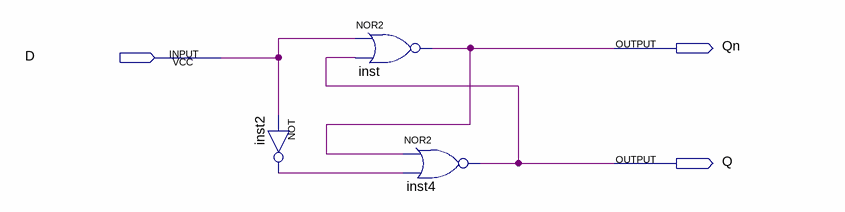
[diagram p0: schematic sheet]
// Quartus schematic Block2.bdf as structural Verilog: 3 symbols, 3 pins
module Block2 (
  input  D,
  output Qn,
  output Q
);

  wire inst2_out;

  not inst2 (inst2_out, D);
  nor inst (Qn, D, Q);
  nor inst4 (Q, Qn, inst2_out);
endmodule
